# Altium schematic sheet Sensor_Section.SchDoc
size 420 x 297 mm; DocumentNumber: 13; SheetNumber: 13; SheetTotal: 17
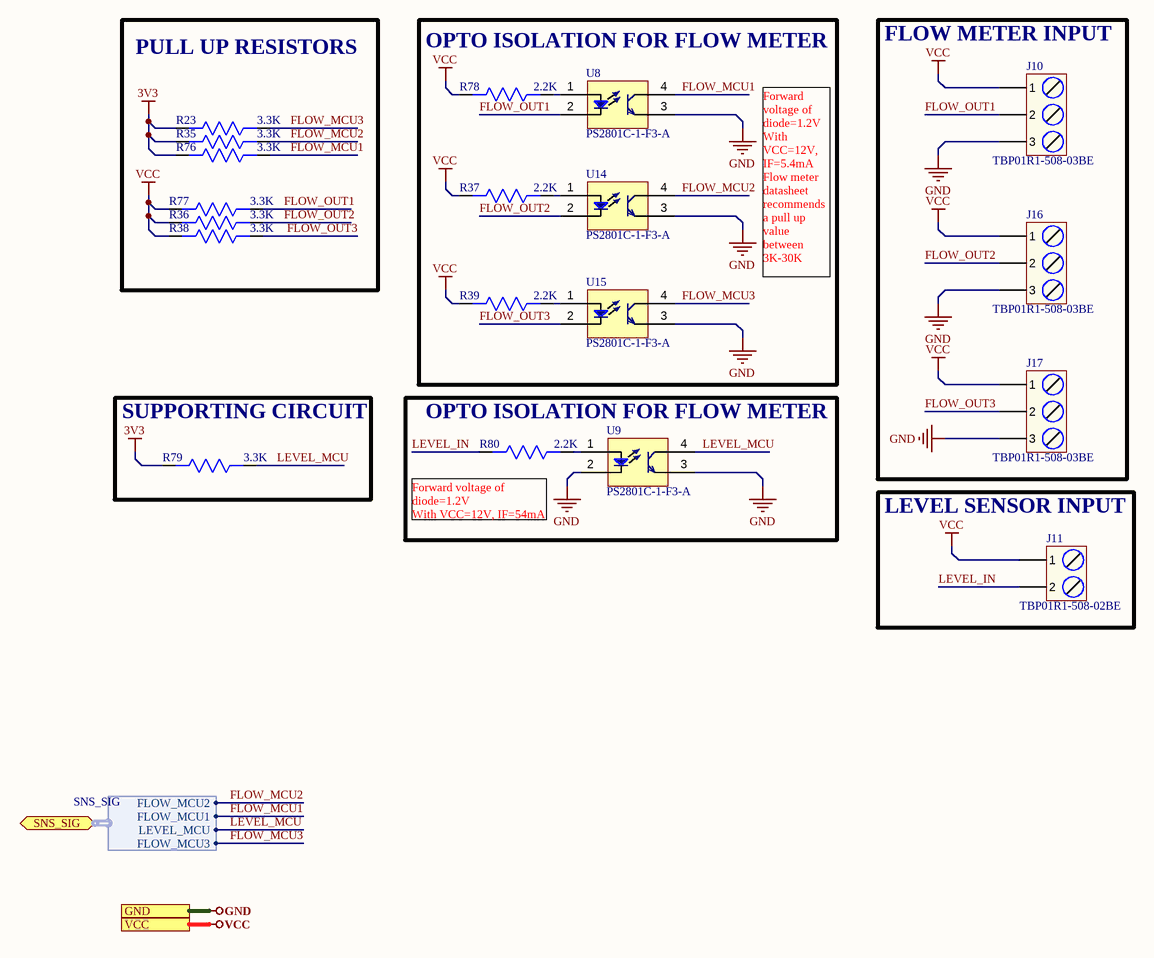
[diagram p0: Sensor_Section.SchDoc]

## Parts
J10  TBP01R1-508-03BE  [TBP01R1-508-03BE]
J11  TBP01R1-508-02BE  [TBP01R1-508-02BE]
J16  TBP01R1-508-03BE  [TBP01R1-508-03BE]
J17  TBP01R1-508-03BE  [TBP01R1-508-03BE]
R23  3.3K  [RES-0603]
R35  3.3K  [RES-0603]
R36  3.3K  [RES-0603]
R37  2.2K  [Res-0603]
R38  3.3K  [Res-0603]
R39  2.2K  [Res-0603]
R76  3.3K  [RES-0603]
R77  3.3K  [RES-0603]
R78  2.2K  [Res-0603]
R79  3.3K  [RES-0603]
R80  2.2K  [Res-0603]
U8  PS2801C-1-F3-A  [PS2801C-1-F3-A]
U9  PS2801C-1-F3-A  [PS2801C-1-F3-A]
U14  PS2801C-1-F3-A  [PS2801C-1-F3-A]
U15  PS2801C-1-F3-A  [PS2801C-1-F3-A]

## Blocks framed on the sheet
PULL UP RESISTORS: R23 R35 R36 R38 R76 R77
OPTO ISOLATION FOR FLOW METER: R37 R39 R78 U8 U14 U15
FLOW METER INPUT: J10 J16 J17
SUPPORTING CIRCUIT: R79
OPTO ISOLATION FOR FLOW METER: R80 U9
LEVEL SENSOR INPUT: J11

## Ports
GND, SNS_SIG (bidir, harness SNS_SIG), VCC

## Harnesses
SNS_SIG: FLOW_MCU1, LEVEL_MCU, FLOW_MCU2, FLOW_MCU3

## Nets
3V3: R23.2 R35.2 R76.2 R79.2
GND: J10.3 J16.3 J17.3 U8.3(E) U9.2(Ca) U9.3(E) U14.3(E) U15.3(E) ; port GND
VCC: J10.1 J11.1 J16.1 J17.1 R36.2 R37.2 R38.2 R39.2 R77.2 R78.2 ; port VCC
FLOW_MCU1: R76.1 U8.4(C) ; port SNS_SIG.FLOW_MCU1
FLOW_MCU2: R35.1 U14.4(C) ; port SNS_SIG.FLOW_MCU2
FLOW_MCU3: R23.1 U15.4(C) ; port SNS_SIG.FLOW_MCU3
FLOW_OUT1: J10.2 R77.1 U8.2(Ca)
FLOW_OUT2: J16.2 R36.1 U14.2(Ca)
FLOW_OUT3: J17.2 R38.1 U15.2(Ca)
LEVEL_IN: J11.2 R80.2
LEVEL_MCU: R79.1 U9.4(C) ; port SNS_SIG.LEVEL_MCU
NetR37_1: R37.1 U14.1(An)
NetR39_1: R39.1 U15.1(An)
NetR78_1: R78.1 U8.1(An)
NetR80_1: R80.1 U9.1(An)

## Notes on the sheet
- Forward voltage of diode=1.2V
  With VCC=12V, IF=5.4mA
  Flow meter datasheet recommends a pull up value between 3K-30K
- (near R80) Forward voltage of diode=1.2V
  With VCC=12V, IF=54mA
- File:
- Title:
- Date:
- Page
- Num:
- Total:
- Drawn By: Huzaifa Ali

## Library data of the parts
J10 J16 J17 = TBP01R1-508-03BE: TERMINAL BLOCK, PLUGGABLE, 5.08,; Manufacturer: CUI Devices; Supplier 1: Arrow Electronics; Manufacturer Part Number: TBP01R1-508-03BE; RoHS: Yes; Category: Terminal Blocks; Stock 1: 2069; Pricing 1: 1=0.52380, 10=0.21370, 100=0.18450, 600=0.17070 (USD); Supplier Part Number 1: TBP01R1-508-03BE
J11 = TBP01R1-508-02BE: TERMINAL BLOCK, PLUGGABLE, 5.08,; Manufacturer: CUI Devices; Supplier 1: Arrow Electronics; Manufacturer Part Number: TBP01R1-508-02BE; RoHS: Yes; Category: Terminal Blocks; Stock 1: 1821; Pricing 1: 1=0.57450, 10=0.23530, 25=0.18730, 50=0.17170, 100=0.16040, 400=0.14010, 800=0.12060, 1200=0.11290 (USD); Supplier Part Number 1: TBP01R1-508-02BE
R23 R35 R36 R38 R76 R77 R79 = RC0603FR-073K3L: RES SMD 3.3K OHM 1% 1/10W 0603; Manufacturer: Yageo Phycomp; Temperature Coefficient: 100ppm/°C; Resistance: 3.3kR; Voltage Rating (DC): 50V; Power Rating: 100mW; Supplier 1: Digi-Key; Manufacturer Part Number: RC0603FR-073K3L; Stock 1: 6863000; Pricing 1: 1=0.1, 10=0.024, 100=0.0097, 1000=0.00437, 2500=0.00379 (USD); Mount: Surface Mount; Case/Package: 0603; Number of Pins: 2; Min Operating Temperature: -55°C; Max Operating Temperature: 155°C; Tolerance: 1%; Packaging: Cut Tape; Length: 1.6mm; Height: 0.45mm; Width: 800um; Depth: 0.8mm; REACH SVHC: No SVHC; Lead Free: Lead Free; Supplier Part Number 1: 311-3.30KHRCT-ND
  R38: LCSC Part Number: C108078
R37 R39 R78 R80 = RC0603FR-072K2L: RES 2.2K OHM 1% 1/10W 0603; Manufacturer: Yageo; Resistance: 2.2kR; Temperature Coefficient: 100ppm/°C; Power Rating: 100mW; Voltage Rating: 50V; Supplier 1: Digi-Key; Manufacturer Part Number: RC0603FR-072K2L; RoHS: Yes; Category: Chip SMD Resistors; Stock 1: 2808901; Pricing 1: 1=0.10000, 10=0.02100, 100=0.00850, 1000=0.00383, 2500=0.00332 (USD); Case/Package: 0603; Case Code (Imperial): 0603; Case Code (Metric): 1608; Size Code: 0603; Min Operating Temperature: -55°C; Max Operating Temperature: 155°C; Tolerance: 1%; Packaging: Tape and Reel; Resistor Type: Thick Film; Package Quantity: 1; Termination: SMD/SMT; Number of Terminations: 2; Max Power Dissipation: 100mW; Features: Moisture Resistant; Series: RC; Resistance Tolerance: 1%; Construction: Rectangular; Length: 1.6mm; Width: 0.031inch; Height: 0.022inch; Depth: 0.8mm; Lead Free: Lead Free; Military Standard: Not; RoHS Compliant: Yes; Supplier Part Number 1: 311-2.20KHRCT-ND
U8 U9 U14 U15 = PS2801C-1-F3-A: TransistorOptocouplers DC 1 2500Vrms SOP-4_P1.27 Optocouplers RoHS; Manufacturer: CEL; Number of Channels: 1; Collector Emitter Voltage (VCEO): 300mV; Forward Voltage: 1.2V; Max Power Dissipation: 120mW; Max Collector Current: 30mA; Max Output Voltage: 80V; Supplier 1: Digi-Key; Manufacturer Part Number: PS2801C-1-F3-A; Stock 1: 399; Pricing 1: 1=0.77, 10=0.595, 100=0.3825 (USD); Mount: Surface Mount; Case/Package: SOIC; Number of Pins: 4; Min Operating Temperature: -55°C; Max Operating Temperature: 100°C; Packaging: Tape and Reel; Collector Emitter Saturation Voltage: 300mV; Package Quantity: 1; Output Current per Channel: 30mA; Lead Free: Lead Free; ComponentLink1URL: http://www.cel.com/pdf/datasheets/PS2801C-1,PS2801C-4.pdf?src-supplier=Digi-Key; ComponentLink1Description: http://www.cel.com/pdf/datasheets/PS2801C-1,PS2801C-4.pdf?src-supplier=Digi-Key; ComponentLink2URL: http://www.cel.com/pdf/datasheets/how_to_order_optos.pdf?src-supplier=Digi-Key; ComponentLink2Description: http://www.cel.com/pdf/datasheets/how_to_order_optos.pdf?src-supplier=Digi-Key; ComponentLink3URL: http://datasheet.iiic.cc/cel/PS2801C-1-F3-A.pdf?src-supplier=IIIC; ComponentLink3Description: http://datasheet.iiic.cc/cel/PS2801C-1-F3-A.pdf?src-supplier=IIIC; Supplier Part Number 1: PS2801C-1-F3-ACT-ND